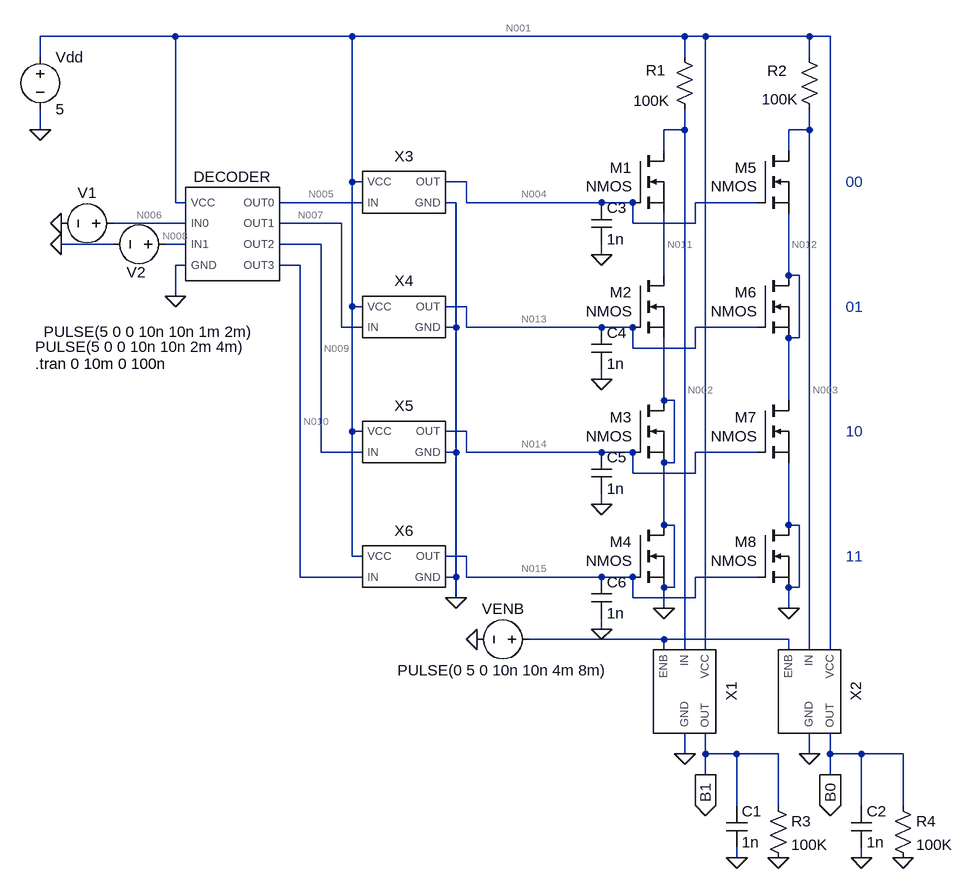
[diagram p0: schematic nand_mprom.asc]
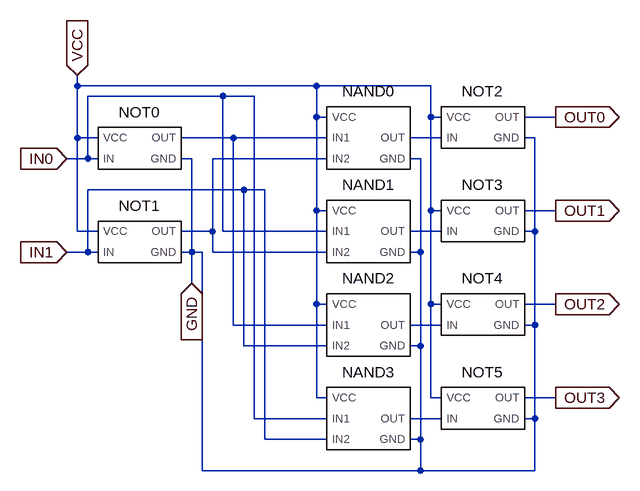
[diagram p1: sub-circuit decoder_2to4.asc]
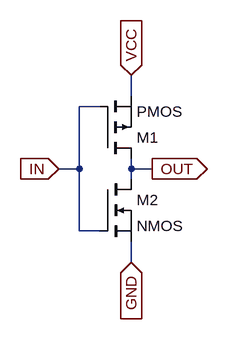
[diagram p2: sub-circuit not.asc]
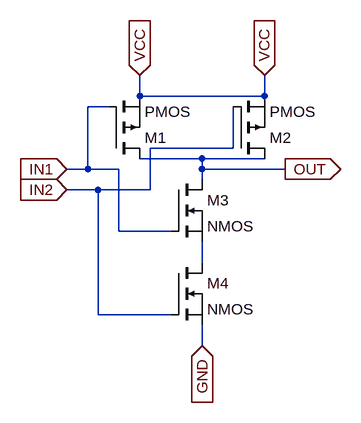
[diagram p3: sub-circuit nand.asc]
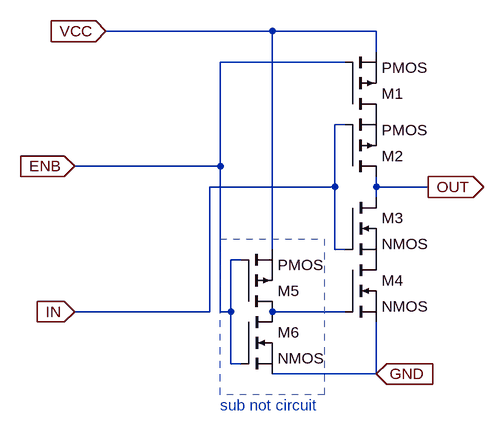
[diagram p4: sub-circuit not_tri.asc]
nand_mprom.asc, the LTspice schematic file:
Version 4.1
SHEET 1 880 1156
WIRE -608 -128 -816 -128
WIRE -336 -128 -608 -128
WIRE 176 -128 -336 -128
WIRE 208 -128 176 -128
WIRE 368 -128 208 -128
WIRE 400 -128 368 -128
WIRE -816 -96 -816 -128
WIRE 176 -96 176 -128
WIRE 368 -96 368 -128
WIRE -816 16 -816 -16
WIRE 176 16 176 -16
WIRE 176 16 144 16
WIRE 368 16 368 -16
WIRE 368 16 336 16
WIRE 144 48 144 16
WIRE 336 48 336 16
WIRE -336 96 -336 -128
WIRE -320 96 -336 96
WIRE -160 96 -192 96
WIRE -608 128 -608 -128
WIRE -592 128 -608 128
WIRE -320 128 -448 128
WIRE -176 128 -192 128
WIRE -160 128 -160 96
WIRE 48 128 -160 128
WIRE 96 128 48 128
WIRE 288 128 192 128
WIRE -592 160 -704 160
WIRE -352 160 -448 160
WIRE 96 160 96 128
WIRE 192 160 192 128
WIRE 192 160 96 160
WIRE -704 192 -784 192
WIRE -592 192 -624 192
WIRE -384 192 -448 192
WIRE 48 208 48 192
WIRE -592 224 -608 224
WIRE -416 224 -448 224
WIRE 144 240 144 144
WIRE 336 240 336 144
WIRE 352 240 336 240
WIRE -608 272 -608 224
WIRE -336 288 -336 96
WIRE -320 288 -336 288
WIRE -160 288 -192 288
WIRE -352 320 -352 160
WIRE -320 320 -352 320
WIRE -176 320 -176 128
WIRE -176 320 -192 320
WIRE -160 320 -160 288
WIRE 48 320 -160 320
WIRE 96 320 48 320
WIRE 288 320 192 320
WIRE 352 336 352 240
WIRE 352 336 336 336
WIRE 96 352 96 320
WIRE 192 352 192 320
WIRE 192 352 96 352
WIRE 48 400 48 384
WIRE 144 432 144 336
WIRE 160 432 144 432
WIRE 336 432 336 336
WIRE -336 480 -336 288
WIRE -320 480 -336 480
WIRE -160 480 -192 480
WIRE -384 512 -384 192
WIRE -320 512 -384 512
WIRE -176 512 -176 320
WIRE -176 512 -192 512
WIRE -160 512 -160 480
WIRE 48 512 -160 512
WIRE 96 512 48 512
WIRE 288 512 192 512
WIRE 160 528 160 432
WIRE 160 528 144 528
WIRE 96 544 96 512
WIRE 192 544 192 512
WIRE 192 544 96 544
WIRE 48 592 48 576
WIRE 144 624 144 528
WIRE 160 624 144 624
WIRE 336 624 336 528
WIRE 352 624 336 624
WIRE -336 672 -336 480
WIRE -320 672 -336 672
WIRE -160 672 -192 672
WIRE -416 704 -416 224
WIRE -320 704 -416 704
WIRE -176 704 -176 512
WIRE -176 704 -192 704
WIRE -160 704 -160 672
WIRE 48 704 -160 704
WIRE 96 704 48 704
WIRE 288 704 192 704
WIRE 160 720 160 624
WIRE 160 720 144 720
WIRE 352 720 352 624
WIRE 352 720 336 720
WIRE -176 736 -176 704
WIRE 96 736 96 704
WIRE 192 736 192 704
WIRE 192 736 96 736
WIRE 144 752 144 720
WIRE 336 752 336 720
WIRE 48 784 48 768
WIRE 144 800 -64 800
WIRE 336 800 144 800
WIRE 144 816 144 800
WIRE 176 816 176 16
WIRE 208 816 208 -128
WIRE 336 816 336 800
WIRE 368 816 368 16
WIRE 400 816 400 -128
WIRE 176 976 176 944
WIRE 208 976 208 944
WIRE 256 976 208 976
WIRE 320 976 256 976
WIRE 368 976 368 944
WIRE 400 976 400 944
WIRE 448 976 400 976
WIRE 512 976 448 976
WIRE 208 1008 208 976
WIRE 400 1008 400 976
WIRE 256 1056 256 976
WIRE 320 1056 320 976
WIRE 448 1056 448 976
WIRE 512 1056 512 976
WIRE 256 1136 256 1120
WIRE 448 1136 448 1120
FLAG 144 752 0
FLAG -816 16 0
FLAG -608 272 0
FLAG -784 160 0
FLAG -784 192 0
FLAG 176 976 0
FLAG 208 1008 B1
IOPIN 208 1008 Out
FLAG 336 752 0
FLAG 368 976 0
FLAG 400 1008 B0
IOPIN 400 1008 Out
FLAG -144 800 0
FLAG 320 1136 0
FLAG 512 1136 0
FLAG 256 1136 0
FLAG 448 1136 0
FLAG 48 208 0
FLAG 48 400 0
FLAG 48 592 0
FLAG 48 784 0
FLAG -176 736 0
SYMBOL nmos 96 48 R0
WINDOW 0 -35 26 Left 2
WINDOW 3 -72 55 Left 2
SYMATTR InstName M1
SYMBOL voltage -816 -112 R0
SYMATTR InstName Vdd
SYMATTR Value 5
SYMBOL decoder_2to4 -528 176 R0
SYMATTR InstName DECODER
SYMBOL nmos 96 240 R0
WINDOW 0 -35 26 Left 2
WINDOW 3 -72 55 Left 2
SYMATTR InstName M2
SYMBOL nmos 96 432 R0
WINDOW 0 -35 26 Left 2
WINDOW 3 -72 55 Left 2
SYMATTR InstName M3
SYMBOL nmos 96 624 R0
WINDOW 0 -35 26 Left 2
WINDOW 3 -72 55 Left 2
SYMATTR InstName M4
SYMBOL res 160 -112 R0
WINDOW 0 -44 36 Left 2
WINDOW 3 -63 83 Left 2
SYMATTR InstName R1
SYMATTR Value 100K
SYMBOL voltage -688 160 R90
WINDOW 0 -32 56 VBottom 2
WINDOW 3 151 -39 VTop 2
WINDOW 123 0 0 Left 0
WINDOW 39 0 0 Left 0
SYMATTR InstName V1
SYMATTR Value PULSE(5 0 0 10n 10n 1m 2m)
SYMBOL voltage -608 192 R90
WINDOW 0 59 60 VBottom 2
WINDOW 3 142 54 VTop 2
WINDOW 123 0 0 Left 0
WINDOW 39 0 0 Left 0
SYMATTR InstName V2
SYMATTR Value PULSE(5 0 0 10n 10n 2m 4m)
SYMBOL nmos 288 48 R0
WINDOW 0 -35 26 Left 2
WINDOW 3 -72 55 Left 2
SYMATTR InstName M5
SYMBOL nmos 288 240 R0
WINDOW 0 -35 26 Left 2
WINDOW 3 -72 55 Left 2
SYMATTR InstName M6
SYMBOL nmos 288 432 R0
WINDOW 0 -35 26 Left 2
WINDOW 3 -72 55 Left 2
SYMATTR InstName M7
SYMBOL nmos 288 624 R0
WINDOW 0 -35 26 Left 2
WINDOW 3 -72 55 Left 2
SYMATTR InstName M8
SYMBOL res 352 -112 R0
WINDOW 0 -49 37 Left 2
WINDOW 3 -57 81 Left 2
SYMATTR InstName R2
SYMATTR Value 100K
SYMBOL not_tri 176 880 R90
SYMATTR InstName X1
SYMBOL not_tri 368 880 R90
SYMATTR InstName X2
SYMBOL voltage -48 800 R90
WINDOW 0 -32 56 VBottom 2
WINDOW 3 32 56 VTop 2
WINDOW 123 0 0 Left 0
WINDOW 39 0 0 Left 0
SYMATTR InstName VENB
SYMATTR Value PULSE(0 5 0 10n 10n 4m 8m)
SYMBOL cap 240 1056 R0
SYMATTR InstName C1
SYMATTR Value 1n
SYMBOL cap 432 1056 R0
SYMATTR InstName C2
SYMATTR Value 1n
SYMBOL res 304 1040 R0
SYMATTR InstName R3
SYMATTR Value 100K
SYMBOL res 496 1040 R0
SYMATTR InstName R4
SYMATTR Value 100K
SYMBOL cap 32 128 R0
SYMATTR InstName C3
SYMATTR Value 1n
SYMBOL cap 32 320 R0
SYMATTR InstName C4
SYMATTR Value 1n
SYMBOL cap 32 512 R0
SYMATTR InstName C5
SYMATTR Value 1n
SYMBOL cap 32 704 R0
SYMATTR InstName C6
SYMATTR Value 1n
SYMBOL not -256 112 R0
SYMATTR InstName X3
SYMBOL not -256 304 R0
SYMATTR InstName X4
SYMBOL not -256 496 R0
SYMATTR InstName X5
SYMBOL not -256 688 R0
SYMATTR InstName X6
TEXT -824 376 Left 2 !.tran 0 10m 0 100n
TEXT 424 96 Left 2 ;00
TEXT 424 288 Left 2 ;01
TEXT 424 480 Left 2 ;10
TEXT 424 672 Left 2 ;11

decoder_2to4.asc, the sub-circuit schematic file:
Version 4.1
SHEET 1 896 680
WIRE 64 48 64 32
WIRE 432 48 64 48
WIRE 608 48 432 48
WIRE 288 64 80 64
WIRE 336 64 288 64
WIRE 432 96 432 48
WIRE 448 96 432 96
WIRE 608 96 608 48
WIRE 624 96 608 96
WIRE 800 96 752 96
WIRE 64 128 64 48
WIRE 96 128 64 128
WIRE 304 128 224 128
WIRE 448 128 304 128
WIRE 624 128 576 128
WIRE 768 128 752 128
WIRE 80 160 80 64
WIRE 80 160 48 160
WIRE 96 160 80 160
WIRE 240 160 224 160
WIRE 448 160 272 160
WIRE 592 160 576 160
WIRE 320 208 80 208
WIRE 352 208 320 208
WIRE 432 240 432 96
WIRE 448 240 432 240
WIRE 608 240 608 96
WIRE 624 240 608 240
WIRE 800 240 752 240
WIRE 64 272 64 128
WIRE 96 272 64 272
WIRE 272 272 272 160
WIRE 272 272 224 272
WIRE 288 272 288 64
WIRE 448 272 288 272
WIRE 624 272 576 272
WIRE 768 272 768 128
WIRE 768 272 752 272
WIRE 80 304 80 208
WIRE 80 304 48 304
WIRE 96 304 80 304
WIRE 240 304 240 160
WIRE 240 304 224 304
WIRE 256 304 240 304
WIRE 272 304 272 272
WIRE 448 304 272 304
WIRE 592 304 592 160
WIRE 592 304 576 304
WIRE 240 352 240 304
WIRE 432 384 432 240
WIRE 448 384 432 384
WIRE 608 384 608 240
WIRE 624 384 608 384
WIRE 800 384 752 384
WIRE 304 416 304 128
WIRE 448 416 304 416
WIRE 624 416 576 416
WIRE 768 416 768 272
WIRE 768 416 752 416
WIRE 320 448 320 208
WIRE 448 448 320 448
WIRE 592 448 592 304
WIRE 592 448 576 448
WIRE 432 528 432 384
WIRE 448 528 432 528
WIRE 608 528 608 384
WIRE 624 528 608 528
WIRE 800 528 752 528
WIRE 336 560 336 64
WIRE 448 560 336 560
WIRE 624 560 576 560
WIRE 768 560 768 416
WIRE 768 560 752 560
WIRE 352 592 352 208
WIRE 448 592 352 592
WIRE 592 592 592 448
WIRE 592 592 576 592
WIRE 256 640 256 304
WIRE 592 640 592 592
WIRE 592 640 256 640
WIRE 768 640 768 560
WIRE 768 640 592 640
FLAG 48 160 IN0
IOPIN 48 160 In
FLAG 48 304 IN1
IOPIN 48 304 In
FLAG 64 32 VCC
IOPIN 64 32 In
FLAG 240 352 GND
IOPIN 240 352 In
FLAG 800 96 OUT0
IOPIN 800 96 Out
FLAG 800 240 OUT1
IOPIN 800 240 Out
FLAG 800 384 OUT2
IOPIN 800 384 Out
FLAG 800 528 OUT3
IOPIN 800 528 Out
SYMBOL not 160 144 R0
SYMATTR InstName NOT0
SYMBOL not 160 288 R0
SYMATTR InstName NOT1
SYMBOL nand 512 144 R0
SYMATTR InstName NAND0
SYMBOL not 688 112 R0
SYMATTR InstName NOT2
SYMBOL nand 512 288 R0
SYMATTR InstName NAND1
SYMBOL not 688 256 R0
SYMATTR InstName NOT3
SYMBOL nand 512 432 R0
SYMATTR InstName NAND2
SYMBOL not 688 400 R0
SYMATTR InstName NOT4
SYMBOL nand 512 576 R0
SYMATTR InstName NAND3
SYMBOL not 688 544 R0
SYMATTR InstName NOT5

not.asc, the sub-circuit schematic file:
Version 4.1
SHEET 1 880 680
WIRE 176 48 176 16
WIRE 128 64 96 64
WIRE 96 160 96 64
WIRE 96 160 64 160
WIRE 176 160 176 144
WIRE 208 160 176 160
WIRE 176 176 176 160
WIRE 96 256 96 160
WIRE 128 256 96 256
WIRE 176 304 176 272
FLAG 64 160 IN
IOPIN 64 160 In
FLAG 208 160 OUT
IOPIN 208 160 Out
FLAG 176 16 VCC
IOPIN 176 16 In
FLAG 176 304 GND
IOPIN 176 304 In
SYMBOL pmos 128 144 M180
SYMATTR InstName M1
SYMBOL nmos 128 176 R0
SYMATTR InstName M2

nand.asc, the sub-circuit schematic file:
Version 4.1
SHEET 1 880 680
WIRE 80 48 80 16
WIRE 272 48 272 16
WIRE 272 48 80 48
WIRE 32 64 0 64
WIRE 224 128 224 64
WIRE 224 128 96 128
WIRE 176 144 80 144
WIRE 272 144 176 144
WIRE 0 160 0 64
WIRE 0 160 -32 160
WIRE 48 160 0 160
WIRE 176 160 176 144
WIRE 304 160 176 160
WIRE 176 176 176 160
WIRE 16 192 -32 192
WIRE 96 192 96 128
WIRE 96 192 16 192
WIRE 48 256 48 160
WIRE 128 256 48 256
WIRE 176 304 176 272
WIRE 16 384 16 192
WIRE 128 384 16 384
WIRE 176 432 176 400
FLAG -32 160 IN1
IOPIN -32 160 In
FLAG 80 16 VCC
IOPIN 80 16 In
FLAG 272 16 VCC
IOPIN 272 16 In
FLAG 304 160 OUT
IOPIN 304 160 Out
FLAG -32 192 IN2
IOPIN -32 192 In
FLAG 176 432 GND
IOPIN 176 432 In
SYMBOL pmos 32 144 M180
SYMATTR InstName M1
SYMBOL nmos 128 176 R0
SYMATTR InstName M3
SYMBOL pmos 224 144 M180
SYMATTR InstName M2
SYMBOL nmos 128 304 R0
SYMATTR InstName M4

not_tri.asc, the sub-circuit schematic file:
Version 4.1
SHEET 1 880 680
WIRE 64 32 -192 32
WIRE 224 32 64 32
WIRE 224 64 224 32
WIRE 176 80 -16 80
WIRE 176 176 160 176
WIRE -16 240 -16 80
WIRE -16 240 -240 240
WIRE 160 272 160 176
WIRE 160 272 -32 272
WIRE 224 272 224 256
WIRE 304 272 224 272
WIRE 224 288 224 272
WIRE 64 368 64 32
WIRE 160 368 160 272
WIRE 176 368 160 368
WIRE 16 384 0 384
WIRE -32 464 -32 272
WIRE -32 464 -240 464
WIRE -16 464 -16 240
WIRE 0 464 0 384
WIRE 0 464 -16 464
WIRE 176 464 64 464
WIRE 0 544 0 464
WIRE 16 544 0 544
WIRE 224 560 224 480
WIRE 224 560 64 560
FLAG -240 240 ENB
IOPIN -240 240 In
FLAG -240 464 IN
IOPIN -240 464 In
FLAG 224 560 GND
IOPIN 224 560 In
FLAG 304 272 OUT
IOPIN 304 272 Out
FLAG -192 32 VCC
IOPIN -192 32 In
SYMBOL pmos 176 160 M180
SYMATTR InstName M1
SYMBOL pmos 176 256 M180
SYMATTR InstName M2
SYMBOL nmos 176 288 R0
SYMATTR InstName M3
SYMBOL nmos 176 384 R0
SYMATTR InstName M4
SYMBOL pmos 16 464 M180
SYMATTR InstName M5
SYMBOL nmos 16 464 R0
SYMATTR InstName M6
TEXT -16 608 Left 2 ;sub not circuit
RECTANGLE Normal 144 592 -16 352 1

The netlist it stands for:
* nand_mprom.asc
M1 N002 N004 N011 N011 NMOS
Vdd N001 0 5
X§DECODER 0 N006 N008 N001 N005 N007 N009 N010 decoder_2to4
M2 N011 N013 0 0 NMOS
M3 0 N014 0 0 NMOS
M4 0 N015 0 0 NMOS
R1 N001 N002 100K
V1 N006 0 PULSE(5 0 0 10n 10n 1m 2m)
V2 N008 0 PULSE(5 0 0 10n 10n 2m 4m)
M5 N003 N004 N012 N012 NMOS
M6 N012 N013 N012 N012 NMOS
M7 N012 N014 0 0 NMOS
M8 0 N015 0 0 NMOS
R2 N001 N003 100K
X§X1 N016 0 N002 N001 B1 not_tri
X§X2 N016 0 N003 N001 B0 not_tri
VENB N016 0 PULSE(0 5 0 10n 10n 4m 8m)
C1 B1 0 1n
C2 B0 0 1n
R3 B1 0 100K
R4 B0 0 100K
C3 N004 0 1n
C4 N013 0 1n
C5 N014 0 1n
C6 N015 0 1n
X§X3 0 N005 N001 N004 not
X§X4 0 N007 N001 N013 not
X§X5 0 N009 N001 N014 not
X§X6 0 N010 N001 N015 not

* block symbol definitions
.subckt decoder_2to4 GND IN0 IN1 VCC OUT0 OUT1 OUT2 OUT3
X§NOT0 GND IN0 VCC N001 not
X§NOT1 GND IN1 VCC N003 not
X§NAND0 GND N001 N003 VCC N002 nand
X§NOT2 GND N002 VCC OUT0 not
X§NAND1 GND IN0 N003 VCC N004 nand
X§NOT3 GND N004 VCC OUT1 not
X§NAND2 GND N001 IN1 VCC N005 nand
X§NOT4 GND N005 VCC OUT2 not
X§NAND3 GND IN0 IN1 VCC N006 nand
X§NOT5 GND N006 VCC OUT3 not
.ends decoder_2to4

.subckt not GND IN VCC OUT
M1 OUT IN VCC VCC PMOS
M2 OUT IN GND GND NMOS
.ends not

.subckt nand GND IN1 IN2 VCC OUT
M1 OUT IN1 VCC VCC PMOS
M3 OUT IN1 N001 N001 NMOS
M2 OUT IN2 VCC VCC PMOS
M4 N001 IN2 GND GND NMOS
.ends nand

.subckt not_tri ENB GND IN VCC OUT
M1 P001 ENB VCC VCC PMOS
M2 OUT IN P001 P001 PMOS
M3 OUT IN P002 P002 NMOS
M4 P002 N001 GND GND NMOS
M5 N001 ENB VCC VCC PMOS
M6 N001 ENB GND GND NMOS
* sub not circuit
.ends not_tri

.model NMOS NMOS
.model PMOS PMOS
.lib standard.mos
.tran 0 10m 0 100n
* 00
* 01
* 10
* 11
.backanno
.end

* Results of the author's LTspice run, read from the files saved beside the schematic
* Operating Point, zero values left out:
*   V(b0) = 3.835 V
*   V(b1) = 3.835 V
*   V(n001) = 5 V
*   V(n002) = 901 mV
*   V(n003) = 901 mV
*   V(n004) = 5 V
*   V(n005) = 100.1 nV
*   V(n006) = 5 V
*   V(n007) = 100.1 nV
*   V(n008) = 5 V
*   V(n009) = 100.1 nV
*   V(n010) = 5 V
*   V(n011) = 428.2 mV
*   V(n012) = 428.2 mV
*   V(n013) = 5 V
*   V(n014) = 5 V
*   V(n015) = 100.1 nV
*   I(R1) = 40.99 µA
*   I(R2) = 40.99 µA
*   I(R3) = 38.35 µA
*   I(R4) = 38.35 µA
*   I(Vdd) = -172.5 µA
*   Id(M1) = 40.99 µA
*   Id(M2) = 40.99 µA
*   Id(M5) = 40.99 µA
*   Id(M7) = 40.99 µA
*   Is(M1) = -40.99 µA
*   Is(M2) = -40.99 µA
*   Is(M5) = -40.99 µA
*   Is(M7) = -40.99 µA